# Altium project Gateway-Device-v1.0.PrjPcb (part 2 of 3)
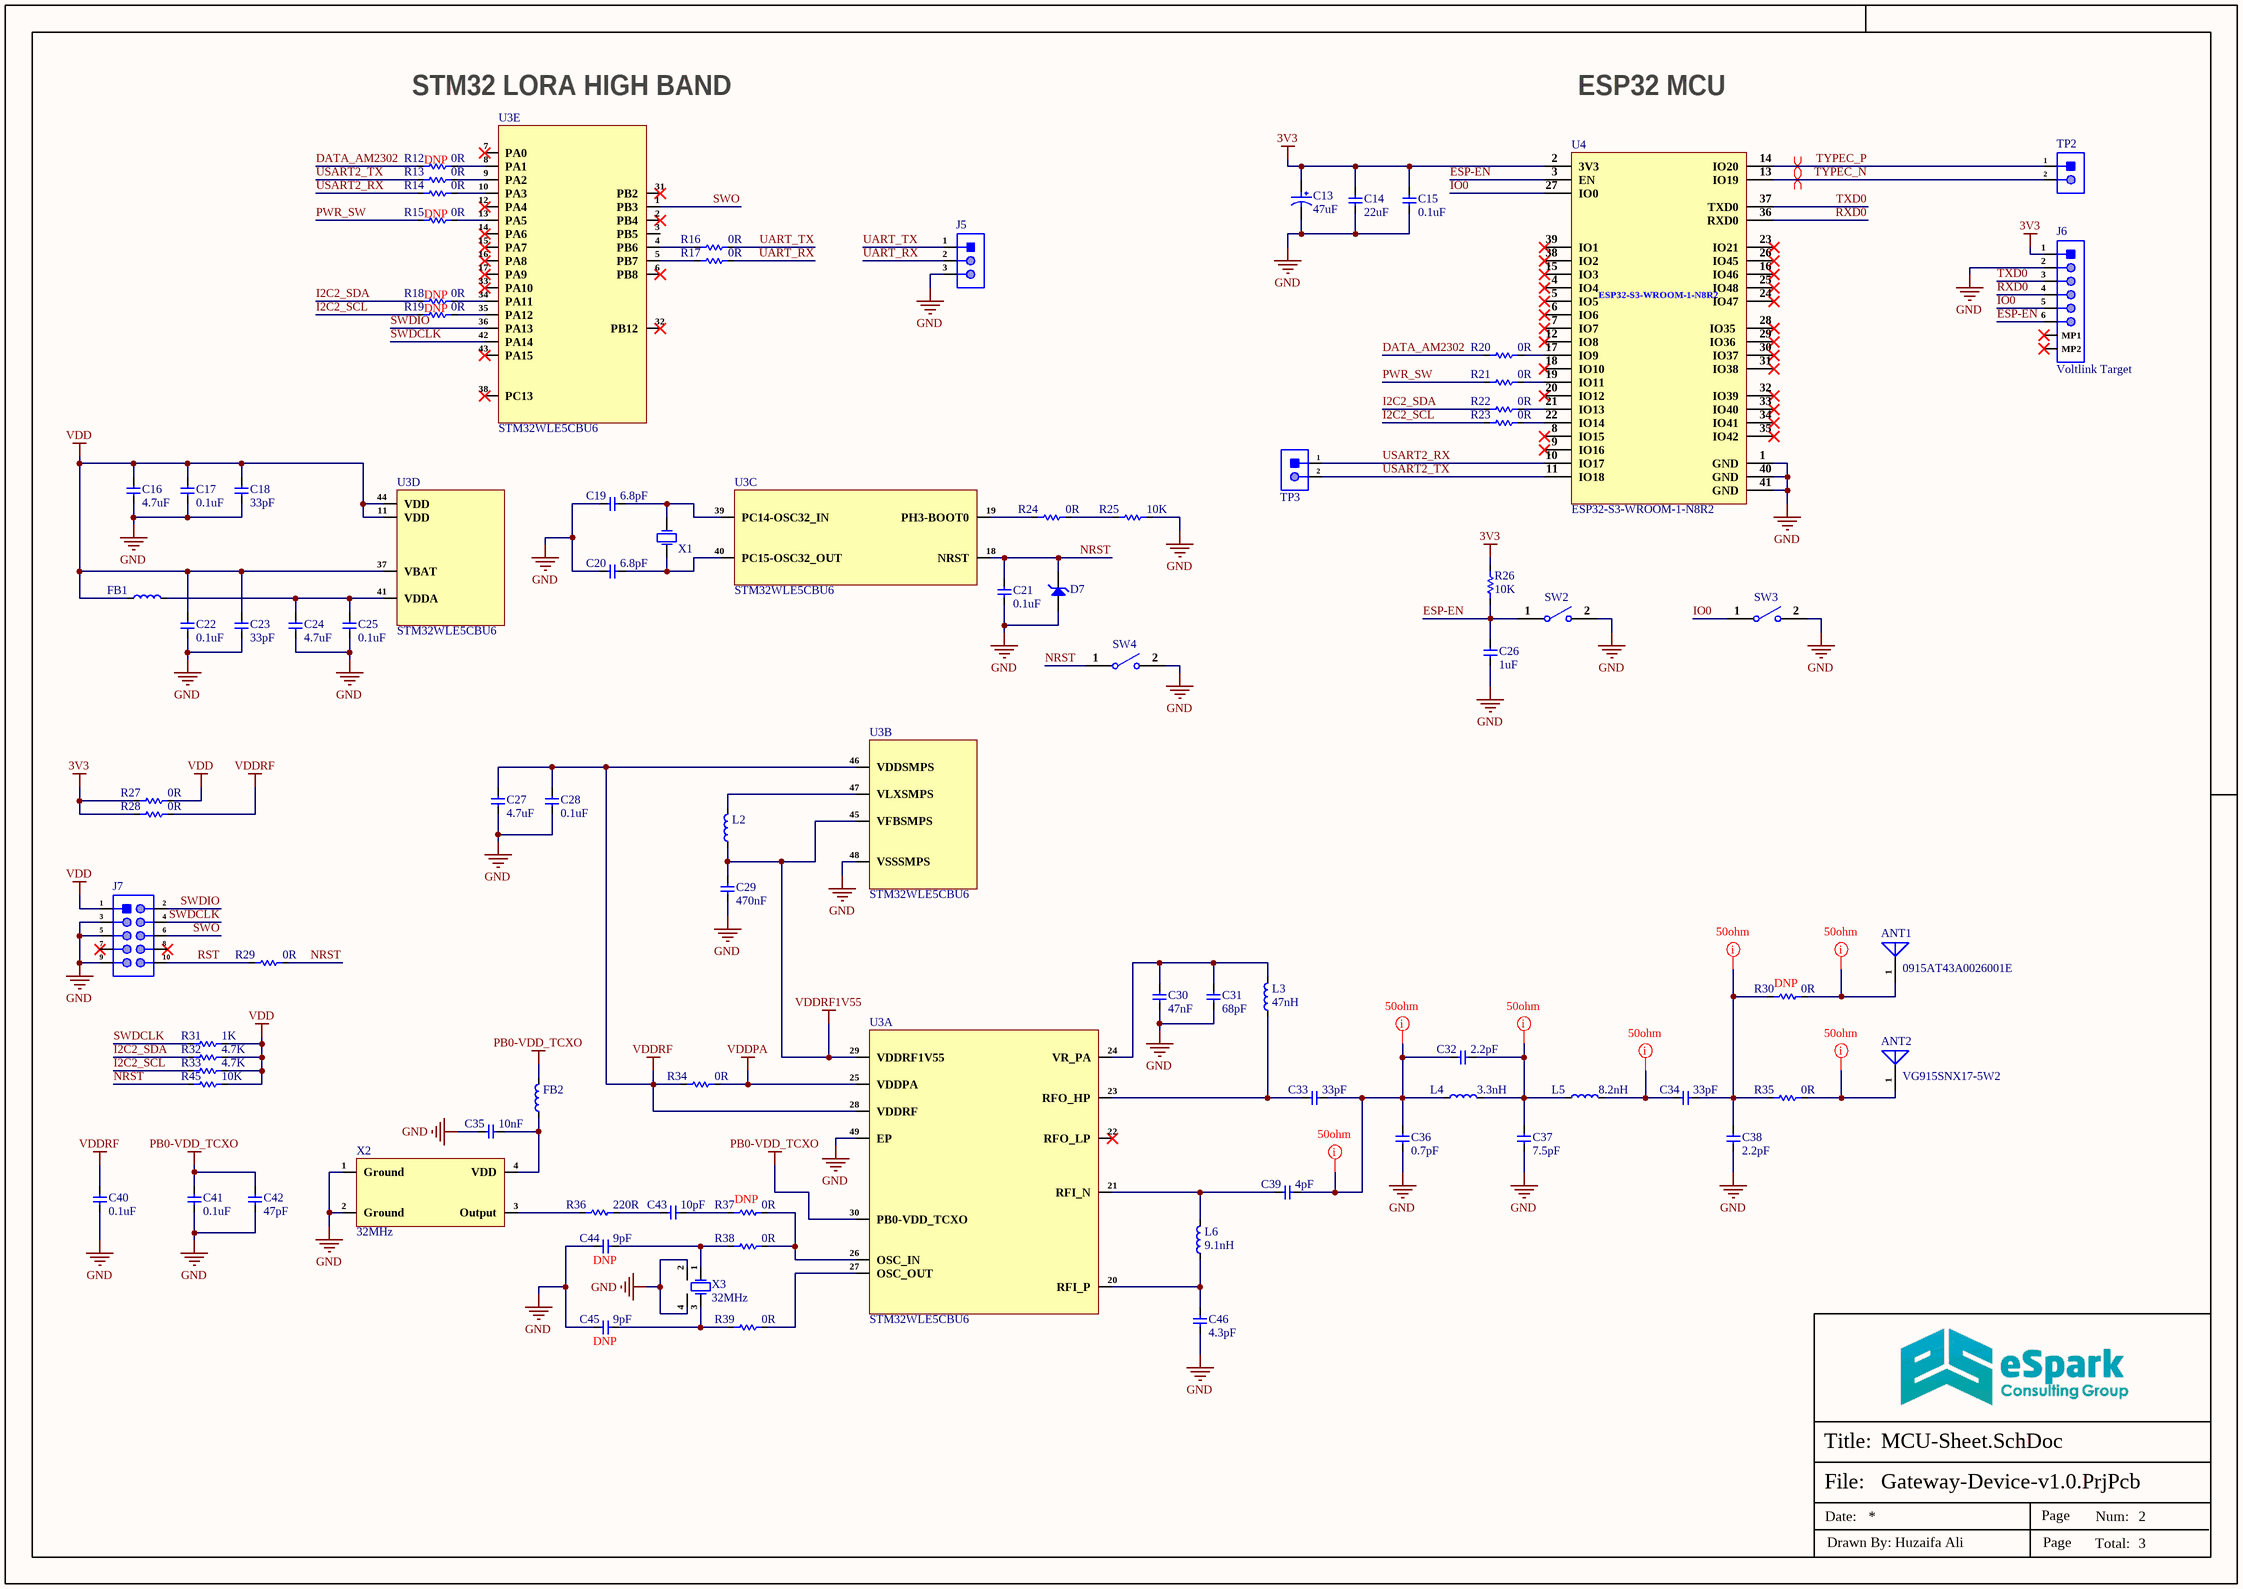
[diagram p3: MCU-Sheet.SchDoc]

## Sheet MCU-Sheet.SchDoc (continued)
### Library data of the parts
ANT1 = 0915AT43A0026001E: RF ANT 915MHZ CHIP SOLDER SMD; Manufacturer: Johanson; Item Type: RF Antennas; Supplier: Digikey; LCSC Part Number: C17443637; Manufacturer Part Number: 0915AT43A0026001E; RoHS: No; Stock: 101852; Pricing: 1=0.82, 10=0.585, 25=0.5268, 100=0.4622, 250=0.43144, 500=0.4129 (USD)
ANT2 = VG915SNX17-5W2: 1.8 Helical Antenna Vertical 915MHz 50W Antennas ROHS; Manufacturer: Vollgo; Manufacturer Part Number: VG915SNX17-5W2; Package: Custom; LCSC Part Number: C718842; Item Type: Antenna; ComponentLink1Description: LCSC; ComponentLink1URL: https://lcsc.com/product-detail/Antennas_Vollgo-VG915SNX17-5W2_C718842.html
C13 = RVT1E470M0505: 47uF 25V 49mA@120Hz ±20% SMD,D5xL5.4mm Aluminum Electrolytic Capacitors - SMD ROHS; Manufacturer: ROQANG; Manufacturer Part Number: RVT1E470M0505; Package: SMD,D5xL5.4mm; LCSC Part Number: C2977553; Item Type: Capacitor; ComponentLink1Description: LCSC; ComponentLink1URL: https://www.lcsc.com/product-detail/Aluminum-Electrolytic-Capacitors-SMD_ROQANG-RVT1E470M0505_C2977553.html
C14 = GRM21BZ71A226ME15L: CAP CER 22UF 10V X7R 0805; Manufacturer: Murata; Material: 4241ConductorMaterial; Tolerance: 20%; Item Type: Capacitor; Supplier: Digi-Key; Supplier Part Number: 490-GRM21BZ71A226ME15LCT-ND; Manufacturer Part Number: GRM21BZ71A226ME15L; RoHS: Yes; Category: Ceramic Capacitors; Stock: 49126; Pricing: 1=0.39, 10=0.259, 50=0.191, 100=0.1556, 500=0.12282, 1000=0.10372 (USD); Package: 0805; Min Operating Temperature: -55°C; Max Operating Temperature: 125°C; Value: 22uF; Voltage Rating: 10V; Length: 2mm; Width: 1.25mm; Height: 1.45mm; Thickness: 1.25mm; ComponentLink1URL: https://datasheet.octopart.com/GRM21BZ71A226ME15L-Murata-datasheet-165579666.pdf?src-supplier=TME; ComponentLink1Description: https://datasheet.octopart.com/GRM21BZ71A226ME15L-Murata-datasheet-165579666.pdf?src-supplier=TME; LCSC Part Number: C907991; ComponentLink2Description: LCSC; ComponentLink2URL: https://www.lcsc.com/product-detail/Multilayer-Ceramic-Capacitors-MLCC-SMD-SMT_Murata-Electronics-GRM21BZ71A226ME15L_C907991.html
C15 C17 C21 C22 C25 C28 C40 C41 = CC0402KRX7R8BB104: CAP CER 0.1UF 25V X7R 0402; Manufacturer: Yageo; Tolerance: 10%; Capacitance: 100nF; Dissipation Factor: 3.5%; Supplier 1: Digi-Key; Manufacturer Part Number: CC0402KRX7R8BB104; RoHS: Yes; Category: Ceramic Capacitors; Stock 1: 1841009; Pricing 1: 1=0.10000, 10=0.03100, 50=0.01700, 100=0.01390, 500=0.00990, 1000=0.00777, 2500=0.00707, 5000=0.00650 (USD); Mount: Surface Mount; Case/Package: 0402; Case Code (Imperial): 0402; Case Code (Metric): 1005; Min Operating Temperature: -55°C; Max Operating Temperature: 125°C; Dielectric: X7R; Voltage Rating: 25V; Voltage Rating (DC): 25V; Packaging: Tape and Reel; Termination: SMD/SMT; Resistor Type: Ceramic; Length: 1mm; Width: 0.02inch; Height: 0.5mm; Thickness: 0.022inch; Depth: 0.5mm; Radiation Hardening: No; Lead Free: Lead Free; Halogen Free: Halogen Free; ComponentLink1URL: https://datasheet.ciiva.com/11464/upy-gphc-x7r-6-3v-to-50v-8-11464889.pdf?src-supplier=Avnet; ComponentLink1Description: https://datasheet.ciiva.com/11464/upy-gphc-x7r-6-3v-to-50v-8-11464889.pdf?src-supplier=Avnet; ComponentLink2URL: https://datasheet.ciiva.com/13210/upy-gphc-x7r-6-3v-to-50v-8-12304-13210908.pdf?src-supplier=Mouser; ComponentLink2Description: https://datasheet.ciiva.com/13210/upy-gphc-x7r-6-3v-to-50v-8-12304-13210908.pdf?src-supplier=Mouser; ComponentLink3URL: https://datasheet.ciiva.com/17437/upy-gphc-x7r-6-3v-to-50v-8-17437357.pdf?src-supplier=Avnet+Europe; ComponentLink3Description: https://datasheet.ciiva.com/17437/upy-gphc-x7r-6-3v-to-50v-8-17437357.pdf?src-supplier=Avnet+Europe; Supplier Part Number 1: 311-2077-1-ND; LCSC Part Number: C105883
C16 C24 C27 = CL05A475MO5NUNC: CAP CER 4.7UF 16V X5R 0402; Manufacturer: Samsung; Material: 4241ConductorMaterial; Tolerance: 20%; Supplier 1: Avnet; Manufacturer Part Number: CL05A475MO5NUNC; RoHS: Yes; Category: Ceramic Capacitors; Stock 1: 50000; Pricing 1: 10000=0.09712 (USD); Mount: Surface Mount; Case/Package: 0402; Case Code (Metric): 1005; Case Code (Imperial): 0402; Min Operating Temperature: -55°C; Max Operating Temperature: 85°C; Packaging: Cut Tape; Capacitance: 4.7uF; Voltage Rating: 16V; Series: CL; Voltage Rating (DC): 16V; Length: 0.039inch; Width: 0.02inch; Height: 550um; Thickness: 0.022inch; RoHS Compliant: Yes; ComponentLink1URL: http://www.farnell.com/datasheets/2710653.pdf?src-supplier=Farnell; ComponentLink1Description: http://www.farnell.com/datasheets/2710653.pdf?src-supplier=Farnell; ComponentLink2URL: http://www.samsungsem.com/kr/support/product-search/mlcc/CL05A475MO5NUNC.jsp?src-supplier=Digikey; ComponentLink2Description: http://www.samsungsem.com/kr/support/product-search/mlcc/CL05A475MO5NUNC.jsp?src-supplier=Digikey; ComponentLink3URL: http://www.farnell.com/datasheets/2710653.pdf?src-supplier=Element14; ComponentLink3Description: http://www.farnell.com/datasheets/2710653.pdf?src-supplier=Element14; ComponentLink4URL: https://datasheet.octopart.com/CL05A475MO5NUNC-Samsung-Electro-Mechanics-datasheet-123102911.pdf?src-supplier=Future+Electronics; ComponentLink4Description: https://datasheet.octopart.com/CL05A475MO5NUNC-Samsung-Electro-Mechanics-datasheet-123102911.pdf?src-supplier=Future+Electronics; ComponentLink5URL: http://www.farnell.com/datasheets/2710653.pdf?src-supplier=Newark; ComponentLink5Description: http://www.farnell.com/datasheets/2710653.pdf?src-supplier=Newark; Supplier Part Number 1: CL05A475MO5NUNC
C18 C23 C33 C34 = GJM1555C1H330GB01D: CAP CER 33PF 50V C0G/NP0 0402; Manufacturer: Murata; Item Type: Capacitors; Material: 4241ConductorMaterial; Tolerance: 2%; Dielectric: 1510DielectricType; Temperature Coefficient: 30ppm/°C; Supplier: Mouser; LCSC Part Number: C76905; Manufacturer Part Number: GJM1555C1H330GB01D; RoHS: Yes; Stock: 30599; Pricing: 1=0.12, 10=0.069, 50=0.069, 100=0.042, 1000=0.028, 10000=0.018 (USD); Case/Package: 343Case; Min Operating Temperature: -55°C; Max Operating Temperature: 125°C; Value: 33pF; Voltage Rating (DC): 50V; Voltage Rating: 50V; Length: 1mm; Width: 500um; Height: 550um; Thickness: 500um; ComponentLink1URL: https://datasheet.octopart.com/GJM1555C1H330GB01D-Murata-datasheet-12511495.pdf?src-supplier=TME; ComponentLink1Description: https://datasheet.octopart.com/GJM1555C1H330GB01D-Murata-datasheet-12511495.pdf?src-supplier=TME
C19 C20 = CC0402CRNPO9BN6R8: CAP CER 6.8PF 50V C0G/NPO 0402; Manufacturer: Yageo; Dielectric: C0G; Tolerance: 2%; Insulation Resistance: 10GR; Item Type: Capacitor; Supplier: Future Electronics; Supplier Part Number: 3247368; Manufacturer Part Number: CC0402CRNPO9BN6R8; RoHS: Yes; Category: Ceramic Capacitors; Stock: 200000; Pricing: 10000=0.0024, 40000=0.0022, 150000=0.0021, 400000=0.002, 1000000=0.0019 (USD); Mounting Technology: Surface Mount; Case/Package: 0402; Case Code (Imperial): 0402; Case Code (Metric): 1005; Weight: 2.3E-05oz; Min Operating Temperature: -55°C; Max Operating Temperature: 125°C; Value: 6.8pF; Packaging: Tape and Reel; Voltage Rating: 50V; Voltage Rating (DC): 50V; Termination: SMD/SMT; Series: CC; Construction: Flat; Length: 1mm; Width: 0.5mm; Height: 0.5mm; Depth: 0.5mm; Radiation Hardening: No; RoHS Compliant: Yes; ComponentLink1URL: https://datasheet.ciiva.com/11587/upy-gp-np0-16v-to-50v-8-11587182.pdf?src-supplier=Avnet; ComponentLink1Description: https://datasheet.ciiva.com/11587/upy-gp-np0-16v-to-50v-8-11587182.pdf?src-supplier=Avnet; LCSC Part Number: C189470
C26 = GRM155R70J105KA12J: CAP CER 1UF 6.3V X7R 0402; Manufacturer: Murata; Item Type: Capacitors; Material: 4241ConductorMaterial; Tolerance: 10%; Supplier: Mouser; LCSC Part Number: C2167130; Manufacturer Part Number: GRM155R70J105KA12J; RoHS: Yes; Stock: 273640; Pricing: 1=0.1, 10=0.01, 50=0.01, 100=0.008, 1000=0.008, 10000=0.007 (USD); Mounting Technology: Surface Mount; Case/Package: 0402; Pins: 2NUMBER; Case Code (Metric): 1005; Case Code (Imperial): 0402; Weight: 0.000212oz; Min Operating Temperature: -55°C; Max Operating Temperature: 125°C; Packaging: Tape and Reel; Value: 1uF; Voltage Rating: 6.3V; Dielectric: X7R; Termination: SMD/SMT; Voltage Rating (DC): 6.3V; Package Quantity: 50000; Series: GRM; Length: 0.039inch; Width: 0.02inch; Height: 550um; Thickness: 0.022inch; RoHS Compliant: Yes; ComponentLink1URL: http://www.mouser.com/ds/2/281/c02e-2905.pdf?src-supplier=Mouser; ComponentLink1Description: http://www.mouser.com/ds/2/281/c02e-2905.pdf?src-supplier=Mouser; ComponentLink2URL: https://datasheet.octopart.com/GRM155R70J105KA12J-Murata-datasheet-32479577.pdf?src-supplier=Future+Electronics; ComponentLink2Description: https://datasheet.octopart.com/GRM155R70J105KA12J-Murata-datasheet-32479577.pdf?src-supplier=Future+Electronics; ComponentLink3URL: https://datasheet.octopart.com/GRM155R70J105KA12J-Murata-datasheet-155345054.pdf?src-supplier=Element14; ComponentLink3Description: https://datasheet.octopart.com/GRM155R70J105KA12J-Murata-datasheet-155345054.pdf?src-supplier=Element14; ComponentLink4URL: http://search.murata.co.jp/Ceramy/image/img/A01X/G101/ENG/GRM155R70J105KA12-01.pdf?src-supplier=Digikey; ComponentLink4Description: http://search.murata.co.jp/Ceramy/image/img/A01X/G101/ENG/GRM155R70J105KA12-01.pdf?src-supplier=Digikey; ComponentLink5URL: https://datasheet.octopart.com/GRM155R70J105KA12J-Murata-datasheet-165579666.pdf?src-supplier=TME; ComponentLink5Description: https://datasheet.octopart.com/GRM155R70J105KA12J-Murata-datasheet-165579666.pdf?src-supplier=TME
C29 = GRM155R61H474KE11D: CAP CER 0.47UF 50V X5R 0402; Manufacturer: Murata; Item Type: Capacitors; Material: 4241ConductorMaterial; Tolerance: 10%; Supplier: Arrow Electronics; LCSC Part Number: C437527; Manufacturer Part Number: GRM155R61H474KE11D; RoHS: Yes; Stock: 22879; Pricing: 7407=0.0141, 15000=0.01 (USD); Mounting Technology: Surface Mount; Case/Package: 0402; Case Code (Imperial): 0402; Case Code (Metric): 1005; Min Operating Temperature: -55°C; Max Operating Temperature: 85°C; Voltage Rating (DC): 50V; Dielectric: X5R; Value: 470nF; Series: GRM; Packaging: Cut Tape; Voltage Rating: 50V; Length: 1mm; Width: 500um; Height: 600um; Thickness: 500um; RoHS Compliant: Yes; ComponentLink1URL: https://datasheet.octopart.com/GRM155R61H474KE11D-Murata-datasheet-149523035.pdf?src-supplier=Newark; ComponentLink1Description: https://datasheet.octopart.com/GRM155R61H474KE11D-Murata-datasheet-149523035.pdf?src-supplier=Newark; ComponentLink2URL: https://datasheet.octopart.com/GRM155R61H474KE11D-Murata-datasheet-99353828.pdf?src-supplier=Future+Electronics; ComponentLink2Description: https://datasheet.octopart.com/GRM155R61H474KE11D-Murata-datasheet-99353828.pdf?src-supplier=Future+Electronics; ComponentLink3URL: http://search.murata.co.jp/Ceramy/image/img/A01X/G101/ENG/GRM155R61H474KE11-01.pdf?src-supplier=Digikey; ComponentLink3Description: http://search.murata.co.jp/Ceramy/image/img/A01X/G101/ENG/GRM155R61H474KE11-01.pdf?src-supplier=Digikey; ComponentLink4URL: https://search.murata.co.jp/Ceramy/image/img/A01X/G101/ENG/GRM155R61H474KE11-01.pdf?src-supplier=Digikey; ComponentLink4Description: https://search.murata.co.jp/Ceramy/image/img/A01X/G101/ENG/GRM155R61H474KE11-01.pdf?src-supplier=Digikey; ComponentLink5URL: https://datasheet.octopart.com/GRM155R61H474KE11D-Murata-datasheet-118179445.pdf?src-supplier=LCSC; ComponentLink5Description: https://datasheet.octopart.com/GRM155R61H474KE11D-Murata-datasheet-118179445.pdf?src-supplier=LCSC; ComponentLink6URL: https://datasheet.octopart.com/GRM155R61H474KE11D-Murata-datasheet-165579666.pdf?src-supplier=TME; ComponentLink6Description: https://datasheet.octopart.com/GRM155R61H474KE11D-Murata-datasheet-165579666.pdf?src-supplier=TME
C30 = CC0402KRX7R9BB473: CAP CER 0.047UF 50V X7R 0402; Manufacturer: Yageo; Material: 4241ConductorMaterial; Tolerance: 10%; Temperature Coefficient: 30ppm/°C; Dielectric: 1511DielectricType; Item Type: Capacitor; Supplier: Future Electronics; Supplier Part Number: 2095687; Manufacturer Part Number: CC0402KRX7R9BB473; RoHS: Yes; Category: Ceramic Capacitors; Stock: 1130000; Pricing: 10000=0.0044, 40000=0.0042, 100000=0.004, 150000=0.0041, 250000=0.0039, 400000=0.0037, 500000=0.0038 (USD); Mounting Technology: Surface Mount; Case/Package: 0402; Case Code (Imperial): 0402; Case Code (Metric): 1005; Min Operating Temperature: -55°C; Max Operating Temperature: 125°C; Packaging: Tape and Reel; Value: 47nF; Voltage Rating: 50V; Series: CC; Voltage Rating (DC): 50V; Length: 0.039inch; Width: 0.02inch; Height: 550um; Thickness: 0.022inch; RoHS Compliant: Yes; Halogen Free: 5694HalogenFree; Lead Free: 5697LeadFree; ComponentLink1URL: https://datasheet.octopart.com/CC0402KRX7R9BB473-Yageo-datasheet-166511530.pdf?src-supplier=Future+Electronics; ComponentLink1Description: https://datasheet.octopart.com/CC0402KRX7R9BB473-Yageo-datasheet-166511530.pdf?src-supplier=Future+Electronics; ComponentLink2URL: http://www.yageo.com/documents/recent/UPY-GPHC_X7R_6.3V-to-50V_18.pdf?src-supplier=Digikey; ComponentLink2Description: http://www.yageo.com/documents/recent/UPY-GPHC_X7R_6.3V-to-50V_18.pdf?src-supplier=Digikey; ComponentLink3URL: https://datasheet.octopart.com/CC0402KRX7R9BB473-Yageo-datasheet-140260305.pdf?src-supplier=Newark; ComponentLink3Description: https://datasheet.octopart.com/CC0402KRX7R9BB473-Yageo-datasheet-140260305.pdf?src-supplier=Newark; LCSC Part Number: C272875
C31 = CC0402FRNPO9BN680: CAP CER 68PF 50V C0G/NPO 0402; Manufacturer: Yageo; Item Type: Capacitors; Supplier: Digikey; LCSC Part Number: C389103; Manufacturer Part Number: CC0402FRNPO9BN680; RoHS: Yes; Stock: 155; Pricing: 1=0.1, 10=0.049, 100=0.0288, 1000=0.01861, 2500=0.01608, 5000=0.01457 (USD); Lead Free: 5697LeadFree; Halogen Free: 5694HalogenFree; ComponentLink1URL: https://datasheet.ciiva.com/15189/getdatasheetpartid-646623-15189115.pdf?src-supplier=Verical; ComponentLink1Description: https://datasheet.ciiva.com/15189/getdatasheetpartid-646623-15189115.pdf?src-supplier=Verical; ComponentLink2URL: https://datasheet.ciiva.com/11587/upy-gp-np0-16v-to-50v-8-11587064.pdf?src-supplier=Avnet; ComponentLink2Description: https://datasheet.ciiva.com/11587/upy-gp-np0-16v-to-50v-8-11587064.pdf?src-supplier=Avnet; ComponentLink3URL: https://datasheet.ciiva.com/13210/upy-gp-np0-16v-to-50v-8-13210234.pdf?src-supplier=Mouser; ComponentLink3Description: https://datasheet.ciiva.com/13210/upy-gp-np0-16v-to-50v-8-13210234.pdf?src-supplier=Mouser
C32 C38 = GRM1555C1H2R2BA01D: CAP CER 2.2PF 50V C0G/NP0 0402; Manufacturer: Murata; Material: Ceramic; Dielectric: C0G; Temperature Coefficient: 30ppm/°C; Item Type: Capacitor; Supplier: Avnet; Supplier Part Number: GRM1555C1H2R2BA01D; Manufacturer Part Number: GRM1555C1H2R2BA01D; RoHS: Yes; Category: Ceramic Capacitors; Stock: 110000; Pricing: 10000=0.00887, 20000=0.00867, 40000=0.00847 (USD); Mounting Technology: Surface Mount; Case/Package: 0402; Case Code (Imperial): 0402; Case Code (Metric): 1005; Min Operating Temperature: -55°C; Max Operating Temperature: 125°C; Value: 2.2pF; Packaging: Tape and Reel; Package Quantity: 1; Termination: SMD/SMT; Series: GRM; Voltage Rating: 50V; Voltage Rating (DC): 50V; Voltage: 50V; Construction: Flat; Length: 1mm; Width: 0.5mm; Height: 0.5mm; Thickness: 0.022inch; Depth: 0.5mm; Radiation Hardening: No; Reach SVHC Compliant: No; RoHS Compliant: Yes; Lead Free: Lead Free; ComponentLink1URL: https://datasheet.ciiva.com/6270/grm1555c1h2r1wa01-01-6270869.pdf?src-supplier=Digi-Key; ComponentLink1Description: https://datasheet.ciiva.com/6270/grm1555c1h2r1wa01-01-6270869.pdf?src-supplier=Digi-Key; ComponentLink2URL: https://datasheet.ciiva.com/18184/getdatasheetpartid-316203-18184296.pdf?src-supplier=Verical; ComponentLink2Description: https://datasheet.ciiva.com/18184/getdatasheetpartid-316203-18184296.pdf?src-supplier=Verical; ComponentLink3URL: https://datasheet.ciiva.com/16440/c02e-16440539.pdf?src-supplier=Future+Electronics; ComponentLink3Description: https://datasheet.ciiva.com/16440/c02e-16440539.pdf?src-supplier=Future+Electronics; ComponentLink4URL: https://datasheet.ciiva.com/6270/partnumbering-e-01-6270873.pdf?src-supplier=Digi-Key; ComponentLink4Description: https://datasheet.ciiva.com/6270/partnumbering-e-01-6270873.pdf?src-supplier=Digi-Key; ComponentLink5URL: https://datasheet.ciiva.com/6270/partnumbering-e-01-6270877.pdf?src-supplier=Digi-Key; ComponentLink5Description: https://datasheet.ciiva.com/6270/partnumbering-e-01-6270877.pdf?src-supplier=Digi-Key; ComponentLink6URL: https://datasheet.ciiva.com/11615/product-11615030.pdf?src-supplier=Avnet; ComponentLink6Description: https://datasheet.ciiva.com/11615/product-11615030.pdf?src-supplier=Avnet; LCSC Part Number: C88927
C35 = GRM155R71H103KA88D: CAP CER 10000PF 50V X7R 0402; Manufacturer: Murata; Item Type: Capacitors; Material: Ceramic; Tolerance: 10%; Voltage: 25V; Supplier: Arrow Electronics; LCSC Part Number: C77019; Manufacturer Part Number: GRM155R71H103KA88D; RoHS: Yes; Stock: 7440000; Pricing: 30000=0.0032, 50000=0.003, 70000=0.0029, 100000=0.0028, 250000=0.0025, 500000=0.0023 (USD); Mounting Technology: Surface Mount; Case/Package: 0402; Pins: 2; Case Code (Metric): 1005; Case Code (Imperial): 0402; Min Operating Temperature: -55°C; Max Operating Temperature: 125°C; Value: 10nF; Packaging: Tape and Reel; Package Quantity: 1; Voltage Rating: 50V; Dielectric: X7R; Termination: SMD/SMT; Series: GRM; Construction: Flat; Voltage Rating (DC): 50V; Length: 1mm; Width: 0.02inch; Height: 0.5mm; Thickness: 0.022inch; Depth: 0.5mm; Radiation Hardening: No; Reach SVHC Compliant: No; RoHS Compliant: Yes; Lead Free: 5697LeadFree; ComponentLink1URL: https://datasheet.ciiva.com/22698/1747449-22698420.pdf?src-supplier=Element14; ComponentLink1Description: https://datasheet.ciiva.com/22698/1747449-22698420.pdf?src-supplier=Element14; ComponentLink2URL: https://datasheet.ciiva.com/19476/1856433-19476546.pdf?src-supplier=Jameco; ComponentLink2Description: https://datasheet.ciiva.com/19476/1856433-19476546.pdf?src-supplier=Jameco; ComponentLink3URL: https://datasheet.ciiva.com/129/product-129810.pdf?src-supplier=Digikey; ComponentLink3Description: https://datasheet.ciiva.com/129/product-129810.pdf?src-supplier=Digikey; ComponentLink4URL: https://datasheet.ciiva.com/11786/0900766b80ef921d-11786340.pdf?src-supplier=Rs; ComponentLink4Description: https://datasheet.ciiva.com/11786/0900766b80ef921d-11786340.pdf?src-supplier=Rs; ComponentLink5URL: https://datasheet.ciiva.com/18100/getdatasheetpartid-27434-18100660.pdf?src-supplier=Verical; ComponentLink5Description: https://datasheet.ciiva.com/18100/getdatasheetpartid-27434-18100660.pdf?src-supplier=Verical; ComponentLink6URL: https://datasheet.ciiva.com/29199/454225-da-01-en-vs-kondensator-0402-29199740.pdf?src-supplier=Conrad; ComponentLink6Description: https://datasheet.ciiva.com/29199/454225-da-01-en-vs-kondensator-0402-29199740.pdf?src-supplier=Conrad; ComponentLink7URL: https://datasheet.ciiva.com/129/grm155r71h103ka88-01-129811.pdf?src-supplier=Digikey; ComponentLink7Description: https://datasheet.ciiva.com/129/grm155r71h103ka88-01-129811.pdf?src-supplier=Digikey; ComponentLink8URL: https://datasheet.ciiva.com/129/grm155r71h103ka88-01-129812.pdf?src-supplier=Digikey; ComponentLink8Description: https://datasheet.ciiva.com/129/grm155r71h103ka88-01-129812.pdf?src-supplier=Digikey; ComponentLink9URL: https://datasheet.ciiva.com/5410/product-5410990.pdf?src-supplier=Mouser; ComponentLink9Description: https://datasheet.ciiva.com/5410/product-5410990.pdf?src-supplier=Mouser; ComponentLink10URL: https://datasheet.ciiva.com/16495/product-16495290.pdf?src-supplier=Future+Electronics; ComponentLink10Description: https://datasheet.ciiva.com/16495/product-16495290.pdf?src-supplier=Future+Electronics
C36 = GJM1555C1HR70BB01D: CAP CER 0.7PF 50V C0G/NP0 0402; Manufacturer: Murata; Item Type: Capacitors; Material: 4241ConductorMaterial; Temperature Coefficient: 30ppm/°C; Supplier: Arrow Electronics; LCSC Part Number: C161349; Manufacturer Part Number: GJM1555C1HR70BB01D; RoHS: Yes; Stock: 979; Pricing: 979=0.0104 (USD); Lead Free: 5697LeadFree; ComponentLink1URL: https://datasheet.ciiva.com/6270/product-6270549.pdf?src-supplier=Digikey; ComponentLink1Description: https://datasheet.ciiva.com/6270/product-6270549.pdf?src-supplier=Digikey; ComponentLink2URL: https://datasheet.ciiva.com/6270/partnumbering-e-01-6270550.pdf?src-supplier=Digikey; ComponentLink2Description: https://datasheet.ciiva.com/6270/partnumbering-e-01-6270550.pdf?src-supplier=Digikey; ComponentLink3URL: https://datasheet.ciiva.com/6270/partnumbering-e-01-6270551.pdf?src-supplier=Digikey; ComponentLink3Description: https://datasheet.ciiva.com/6270/partnumbering-e-01-6270551.pdf?src-supplier=Digikey; ComponentLink4URL: https://datasheet.ciiva.com/11616/product-11616965.pdf?src-supplier=Avnet; ComponentLink4Description: https://datasheet.ciiva.com/11616/product-11616965.pdf?src-supplier=Avnet
C37 = GJM1555C1H7R5BB01D: CAP CER 7.5PF 50V C0G/NP0 0402; Manufacturer: Murata; Item Type: Capacitors; Material: 4241ConductorMaterial; Temperature Coefficient: 30ppm/°C; Supplier: Arrow Electronics; LCSC Part Number: C497526; Manufacturer Part Number: GJM1555C1H7R5BB01D; RoHS: Yes; Stock: 9925; Pricing: 9925=0.0103 (USD); ComponentLink1URL: https://datasheet.ciiva.com/11610/product-11610696.pdf?src-supplier=Avnet; ComponentLink1Description: https://datasheet.ciiva.com/11610/product-11610696.pdf?src-supplier=Avnet
C39 = GJM1555C1H4R0BB01D: CAP CER 4PF 50V C0G/NP0 0402; Manufacturer: Murata; Item Type: Capacitors; Material: 4241ConductorMaterial; Dielectric: C0G; Temperature Coefficient: 30ppm/°C; Supplier: Arrow Electronics; LCSC Part Number: C161323; Manufacturer Part Number: GJM1555C1H4R0BB01D; RoHS: Yes; Stock: 40000; Pricing: 10000=0.0105 (USD); Mounting Technology: Surface Mount; Case/Package: 0402; Case Code (Metric): 1005; Case Code (Imperial): 0402; Min Operating Temperature: -55°C; Max Operating Temperature: 125°C; Value: 4pF; Packaging: Tape and Reel; Package Quantity: 1; Voltage Rating: 50V; Voltage Rating (DC): 50V; Termination: SMD/SMT; Series: GJM; Construction: Flat; Length: 1mm; Width: 0.02inch; Height: 0.5mm; Thickness: 0.022inch; Depth: 0.5mm; Radiation Hardening: No; Lead Free: Lead Free; RoHS Compliant: Yes; ComponentLink1URL: https://datasheet.ciiva.com/11613/product-11613609.pdf?src-supplier=Avnet; ComponentLink1Description: https://datasheet.ciiva.com/11613/product-11613609.pdf?src-supplier=Avnet; ComponentLink2URL: https://datasheet.ciiva.com/26947/getdatasheetpartid-725490-26947669.pdf?src-supplier=Verical; ComponentLink2Description: https://datasheet.ciiva.com/26947/getdatasheetpartid-725490-26947669.pdf?src-supplier=Verical; ComponentLink3URL: https://datasheet.ciiva.com/29542/partnumbering-e-01-29542697.pdf?src-supplier=Digikey; ComponentLink3Description: https://datasheet.ciiva.com/29542/partnumbering-e-01-29542697.pdf?src-supplier=Digikey; ComponentLink4URL: https://datasheet.ciiva.com/29542/partnumbering-e-01-29542696.pdf?src-supplier=Digikey; ComponentLink4Description: https://datasheet.ciiva.com/29542/partnumbering-e-01-29542696.pdf?src-supplier=Digikey; ComponentLink5URL: https://datasheet.ciiva.com/29542/partnumbering-e-01-29542698.pdf?src-supplier=Digikey; ComponentLink5Description: https://datasheet.ciiva.com/29542/partnumbering-e-01-29542698.pdf?src-supplier=Digikey
C42 = GCM1555C1H470FA16D: CAP CER 47PF 50V C0G/NP0 0402; Manufacturer: Murata; Tolerance: 1%; Supplier 1: Digi-Key; Manufacturer Part Number: GCM1555C1H470FA16D; RoHS: No; Category: Ceramic Capacitors; Stock 1: 27098; Pricing 1: 1=0.11000, 10=0.07900, 50=0.04500, 100=0.03730, 500=0.02618, 1000=0.02168, 2500=0.02018, 5000=0.01846 (USD); Mount: Surface Mount; Case/Package: 0402; Case Code (Imperial): 0402; Case Code (Metric): 1005; Min Operating Temperature: -55°C; Max Operating Temperature: 125°C; Packaging: Tape and Reel; Capacitance: 47pF; Voltage Rating: 50V; Ratings: AEC-Q200; ComponentLink1URL: http://search.murata.co.jp/Ceramy/image/img/A01X/G101/ENG/GCM1555C1H470FA16-01.pdf?src-supplier=Digi-Key; ComponentLink1Description: http://search.murata.co.jp/Ceramy/image/img/A01X/G101/ENG/GCM1555C1H470FA16-01.pdf?src-supplier=Digi-Key; Supplier Part Number 1: 490-16445-1-ND; LCSC Part Number: C393684
C43 = GRM1555C1H100JA01D: CAP CER 10PF 50V C0G/NP0 0402; Manufacturer: Murata; Material: Ceramic; Dielectric: C0G; Tolerance: 5%; Item Type: Capacitor; Supplier: Arrow Electronics; Supplier Part Number: GRM1555C1H100JA01D; Manufacturer Part Number: GRM1555C1H100JA01D; RoHS: Yes; Category: Ceramic Capacitors; Stock: 3860000; Pricing: 10000=0.0034, 50000=0.0027, 100000=0.0023, 250000=0.0021 (USD); Mounting Technology: Surface Mount; Case/Package: 0402; Case Code (Metric): 1005; Case Code (Imperial): 0402; Min Operating Temperature: -55°C; Max Operating Temperature: 125°C; Value: 10pF; Voltage Rating: 50V; Packaging: Tape and Reel; Package Quantity: 1; Voltage Rating (DC): 50V; Termination: SMD/SMT; Series: GRM; Voltage: 50V; Construction: Flat; Length: 1mm; Width: 0.02inch; Height: 0.5mm; Depth: 0.5mm; Thickness: 0.022inch; Radiation Hardening: No; RoHS Compliant: Yes; Lead Free: Lead Free; Reach SVHC Compliant: No; ComponentLink1URL: https://datasheet.ciiva.com/2989/product-2989280.pdf?src-supplier=Avnet; ComponentLink1Description: https://datasheet.ciiva.com/2989/product-2989280.pdf?src-supplier=Avnet; ComponentLink2URL: https://datasheet.ciiva.com/18184/getdatasheetpartid-307234-18184164.pdf?src-supplier=Verical; ComponentLink2Description: https://datasheet.ciiva.com/18184/getdatasheetpartid-307234-18184164.pdf?src-supplier=Verical; ComponentLink3URL: https://datasheet.ciiva.com/29200/453545-da-01-en-vs-kondensator-0402-29200107.pdf?src-supplier=Conrad; ComponentLink3Description: https://datasheet.ciiva.com/29200/453545-da-01-en-vs-kondensator-0402-29200107.pdf?src-supplier=Conrad; ComponentLink4URL: https://datasheet.ciiva.com/7828/1666664-7828812.pdf?src-supplier=Element14; ComponentLink4Description: https://datasheet.ciiva.com/7828/1666664-7828812.pdf?src-supplier=Element14; ComponentLink5URL: https://datasheet.ciiva.com/6271/partnumbering-e-01-6271159.pdf?src-supplier=Digi-Key; ComponentLink5Description: https://datasheet.ciiva.com/6271/partnumbering-e-01-6271159.pdf?src-supplier=Digi-Key; ComponentLink6URL: https://datasheet.ciiva.com/6271/partnumbering-e-01-6271158.pdf?src-supplier=Digi-Key; ComponentLink6Description: https://datasheet.ciiva.com/6271/partnumbering-e-01-6271158.pdf?src-supplier=Digi-Key; ComponentLink7URL: https://datasheet.ciiva.com/6271/partnumbering-e-01-6271068.pdf?src-supplier=Digi-Key; ComponentLink7Description: https://datasheet.ciiva.com/6271/partnumbering-e-01-6271068.pdf?src-supplier=Digi-Key; LCSC Part Number: C76946
C44 C45 = CQ0402CRNPO9BN9R0: CAP CER 9PF 50V C0G/NPO 0402; Manufacturer: Yageo; Item Type: Capacitor; Supplier: Digikey; Supplier Part Number: CQ0402CRNPO9BN9R0-ND; Manufacturer Part Number: CQ0402CRNPO9BN9R0; RoHS: Yes; Category: Ceramic Capacitors; Pricing: 10000=0.02594 (USD); Mounting Technology: Surface Mount; Case/Package: 0402; Min Operating Temperature: -55°C; Max Operating Temperature: 125°C; Packaging: Tape and Reel; Value: 9pF; Voltage Rating: 50V; Series: CQ; ComponentLink1URL: http://www.yageo.com/documents/recent/UPY-High%20Q_NP0_16V-to-250V_13.pdf?src-supplier=Digikey; ComponentLink1Description: http://www.yageo.com/documents/recent/UPY-High%20Q_NP0_16V-to-250V_13.pdf?src-supplier=Digikey; LCSC Part Number: C577403
C46 = GJM1555C1H4R3BB01D: CAP CER 4.3PF 50V C0G/NP0 0402; Manufacturer: Murata; Item Type: Capacitors; Material: 4241ConductorMaterial; Dielectric: C0G; Temperature Coefficient: 30ppm/°C; Supplier: Mouser; LCSC Part Number: C426034; Manufacturer Part Number: GJM1555C1H4R3BB01D; RoHS: Yes; Stock: 11754; Pricing: 1=0.1, 10=0.05, 50=0.05, 100=0.03, 1000=0.021, 10000=0.011 (USD); Mounting Technology: Surface Mount; Case/Package: 0402; Case Code (Metric): 1005; Case Code (Imperial): 0402; Min Operating Temperature: -55°C; Max Operating Temperature: 125°C; Package Quantity: 1; Packaging: Tape and Reel; Value: 4.3pF; Voltage Rating: 50V; Voltage Rating (DC): 50V; Termination: SMD/SMT; Series: GJM; Construction: Flat; Length: 1mm; Width: 0.02inch; Height: 0.5mm; Thickness: 0.022inch; Depth: 0.5mm; Radiation Hardening: No; RoHS Compliant: Yes; ComponentLink1URL: https://datasheet.ciiva.com/11613/product-11613476.pdf?src-supplier=Avnet; ComponentLink1Description: https://datasheet.ciiva.com/11613/product-11613476.pdf?src-supplier=Avnet; ComponentLink2URL: https://datasheet.ciiva.com/29536/partnumbering-e-01-29536086.pdf?src-supplier=Digikey; ComponentLink2Description: https://datasheet.ciiva.com/29536/partnumbering-e-01-29536086.pdf?src-supplier=Digikey; ComponentLink3URL: https://datasheet.ciiva.com/29536/partnumbering-e-01-29536085.pdf?src-supplier=Digikey; ComponentLink3Description: https://datasheet.ciiva.com/29536/partnumbering-e-01-29536085.pdf?src-supplier=Digikey
D7 = ESDALC6V1-1U2: TVS DIODE 3VWM ST0201; Manufacturer: STMicroelectronics; Direction: Unidirectional; Value: 12pF; Number of Channels: 1; Reverse Breakdown Voltage: 6.1V; Reverse Standoff Voltage: 3V; Peak Pulse Power: 20W; Power Line Protection: No; Clamping Voltage: 12.2V; ESD Protection: Yes; Test Current: 1mA; Max Reverse Leakage Current: 100nA; Max Breakdown Voltage: 8V; Peak Pulse Current: 2A; Diode Type: ZENER; Supplier: Future Electronics; Supplier Part Number: 3110124; Manufacturer Part Number: ESDALC6V1-1U2; RoHS: Yes; Category: TVS Diodes; Stock: 405000; Pricing: 15000=0.0377, 45000=0.0364, 60000=0.0361, 150000=0.0351, 225000=0.0341 (USD); Mounting Technology: Surface Mount; Case/Package: 0201; Pins: 2; Case Code (Metric): 0603; Case Code (Imperial): 0201; Min Operating Temperature: -40°C; Max Operating Temperature: 125°C; Packaging: Tape and Reel; Number of Elements: 1; Number of Unidirectional Channels: 1; Min Breakdown Voltage: 6.1V; Breakdown Voltage: 6.1V; Polarity: Unidirectional; Termination: SMD/SMT; Leakage Current: 100nA; Max Power Dissipation: 20W; Power Dissipation: 20W; Series: ESDA, TRANSIL™; Length: 0.6mm; Width: 0.35mm; Height: 0.33mm; Depth: 0.3mm; Radiation Hardening: No; Reach SVHC Compliant: No; Lead Free: Lead Free; RoHS Compliant: Yes; ComponentLink1URL: https://datasheet.ciiva.com/1276/1684876-1276912.pdf?src-supplier=Element14; ComponentLink1Description: https://datasheet.ciiva.com/1276/1684876-1276912.pdf?src-supplier=Element14; ComponentLink2URL: https://datasheet.ciiva.com/4507/cd00212838-88488-4507763.pdf?src-supplier=Mouser; ComponentLink2Description: https://datasheet.ciiva.com/4507/cd00212838-88488-4507763.pdf?src-supplier=Mouser; ComponentLink3URL: https://datasheet.ciiva.com/16205/cd00212838-16205762.pdf?src-supplier=Future+Electronics; ComponentLink3Description: https://datasheet.ciiva.com/16205/cd00212838-16205762.pdf?src-supplier=Future+Electronics; ComponentLink4URL: https://datasheet.ciiva.com/15143/getdatasheetpartid-185245-15143908.pdf?src-supplier=Verical; ComponentLink4Description: https://datasheet.ciiva.com/15143/getdatasheetpartid-185245-15143908.pdf?src-supplier=Verical; ComponentLink5URL: https://datasheet.ciiva.com/22695/1684876-22695674.pdf?src-supplier=Element14; ComponentLink5Description: https://datasheet.ciiva.com/22695/1684876-22695674.pdf?src-supplier=Element14; ComponentLink6URL: https://datasheet.ciiva.com/337/cd00212838-337652.pdf?src-supplier=Digikey; ComponentLink6Description: https://datasheet.ciiva.com/337/cd00212838-337652.pdf?src-supplier=Digikey; ComponentLink7URL: https://datasheet.ciiva.com/337/cd00212838-337651.pdf?src-supplier=Digikey; ComponentLink7Description: https://datasheet.ciiva.com/337/cd00212838-337651.pdf?src-supplier=Digikey; ComponentLink8URL: https://datasheet.ciiva.com/337/cd00212838-337653.pdf?src-supplier=Digikey; ComponentLink8Description: https://datasheet.ciiva.com/337/cd00212838-337653.pdf?src-supplier=Digikey; ComponentLink9URL: https://datasheet.ciiva.com/11193/cd00212838-11193350.pdf?src-supplier=Avnet; ComponentLink9Description: https://datasheet.ciiva.com/11193/cd00212838-11193350.pdf?src-supplier=Avnet; ComponentLink10URL: https://datasheet.ciiva.com/41443/001184301-da-01-en-transil-sgl-un-esdalc6v1-1u2-st-0201-stm-41443159.pdf?src-supplier=Conrad; ComponentLink10Description: https://datasheet.ciiva.com/41443/001184301-da-01-en-transil-sgl-un-esdalc6v1-1u2-st-0201-stm-41443159.pdf?src-supplier=Conrad
FB1 = FCM1608KF-601T03: 500mΩ ±25% 600Ω@100MHz 0603 Ferrite Beads ROHS; Manufacturer: Tai Tech; Current Rating: 350mA; Number of Circuits: 1NUMBER; Impedance: 600R; DC Resistance (DCR): 500mR; Supplier: Digikey; LCSC Part Number: C141723; Manufacturer Part Number: FCM1608KF-601T03; RoHS: No; Item Type: Ferrite Bead; Pricing: 1=0.1, 10=0.02, 25=0.0176, 50=0.0158, 100=0.0142, 250=0.01236, 500=0.01106, 1000=0.00986 (USD); Length: 1.6mm; Width: 800um; Height: 800um; Reach SVHC Compliant: 4188SVHC
FB2 = BLM15HG102SN1D: FERRITE BEAD 1 KOHM 0402 1LN; Manufacturer: Murata; Item Type: Ferrite Beads; Material: Steel,Ferrite; Impedance: 1kR; Tolerance: 25%; Current Rating: 250mA; Number of Lines: 1; DC Resistance (DCR): 1.1R; Test Frequency: 100MHz; Shielding: 202Shielding; Number of Circuits: 1NUMBER; Supplier: Arrow Electronics; LCSC Part Number: C76889; Manufacturer Part Number: BLM15HG102SN1D; RoHS: Yes; Stock: 520000; Pricing: 10000=0.0226 (USD); Case/Package: 0402; Pins: 2; Core Material: Ferrite; Case Code (Metric): 1005; Case Code (Imperial): 0402; Min Operating Temperature: -55°C; Max Operating Temperature: 125°C; Package Quantity: 1; Packaging: Tape and Reel; Max Current Rating: 250mA; Max DC Current: 250mA; Termination: SMD/SMT; DC Current: 250mA; Series: BLM15H; DC Resistance-Max: 1.1R; Frequency: 100MHz; RMS Current (Irms): 250mA; ESR: 1.1R; Length: 1mm; Width: 0.5mm; Height: 0.5mm; Depth: 0.5mm; Radiation Hardening: No; Reach SVHC Compliant: No; Military Standard: Not; RoHS Compliant: Yes; Lead Free: 5697LeadFree; ComponentLink1URL: https://datasheet.ciiva.com/11799/0900766b811b5866-11799183.pdf?src-supplier=Rs; ComponentLink1Description: https://datasheet.ciiva.com/11799/0900766b811b5866-11799183.pdf?src-supplier=Rs; ComponentLink2URL: https://datasheet.ciiva.com/18089/getdatasheetpartid-153017-18089624.pdf?src-supplier=Verical; ComponentLink2Description: https://datasheet.ciiva.com/18089/getdatasheetpartid-153017-18089624.pdf?src-supplier=Verical; ComponentLink3URL: https://datasheet.ciiva.com/41449/001172203-da-01-en-drossel-0402-1000r-21-0x0-5mm-10000st-41449490.pdf?src-supplier=Conrad; ComponentLink3Description: https://datasheet.ciiva.com/41449/001172203-da-01-en-drossel-0402-1000r-21-0x0-5mm-10000st-41449490.pdf?src-supplier=Conrad; ComponentLink4URL: https://datasheet.ciiva.com/29347/442241-da-01-en-chip-drossel-0402-1000r-250ma-1-0x0-5mm-29347884.pdf?src-supplier=Conrad; ComponentLink4Description: https://datasheet.ciiva.com/29347/442241-da-01-en-chip-drossel-0402-1000r-250ma-1-0x0-5mm-29347884.pdf?src-supplier=Conrad; ComponentLink5URL: https://datasheet.ciiva.com/1466/5168-1466915.pdf?src-supplier=Element14; ComponentLink5Description: https://datasheet.ciiva.com/1466/5168-1466915.pdf?src-supplier=Element14; ComponentLink6URL: https://datasheet.ciiva.com/1466/5168-1466916.pdf?src-supplier=Element14; ComponentLink6Description: https://datasheet.ciiva.com/1466/5168-1466916.pdf?src-supplier=Element14; ComponentLink7URL: https://datasheet.ciiva.com/1012/l0110s0101blm15h-1012789.pdf?src-supplier=Digikey; ComponentLink7Description: https://datasheet.ciiva.com/1012/l0110s0101blm15h-1012789.pdf?src-supplier=Digikey; ComponentLink8URL: https://datasheet.ciiva.com/1012/l0110s0101blm15h-1012788.pdf?src-supplier=Digikey; ComponentLink8Description: https://datasheet.ciiva.com/1012/l0110s0101blm15h-1012788.pdf?src-supplier=Digikey; ComponentLink9URL: https://datasheet.ciiva.com/1012/l0110s0101blm15h-1012790.pdf?src-supplier=Digikey; ComponentLink9Description: https://datasheet.ciiva.com/1012/l0110s0101blm15h-1012790.pdf?src-supplier=Digikey
J5 = X6511WV-03H-C60D30: Gold 250V 3A Straight Square Pins 2.5mm 3P 260℃ 6mm -40℃~+105℃ 3mm 2.54mm Plugin Black Brass 1x3P Plugin,P=2.54mm Pin Headers ROHS; Manufacturer: XKB; Item Type: Male Header; Manufacturer Part Number: X6511WV-03H-C60D30; Package: Plugin,P=2.54mm; LCSC Part Number: C706875; ComponentLink1Description: LCSC; ComponentLink1URL: https://www.lcsc.com/product-detail/Pin-Headers_XKB-Connectivity-X6511WV-03H-C60D30_C706875.html
J6 = C145963: 1x6P SH 1 1mm 6 SMD,P=1mm Wire To Board / Wire To Wire Connector ROHS; Manufacturer: BOOMELE; Manufacturer Part Number: C145963; Package: SMD,P=1mm; LCSC Part Number: C145963; Item Type: Connector; ComponentLink1Description: LCSC; ComponentLink1URL: https://www.lcsc.com/product-detail/Wire-To-Board-Wire-To-Wire-Connector_BOOMELE-Boom-Precision-Elec-C145963_C145963.html
J7 = X1321WVS-2x05J-C40D53: Gold 250V 1A Brick nogging Square Pins 1mm 10P 260℃ 4mm -40℃~+105℃ 1.27mm 双排 Black Brass 2x5P SMD,P=1.27mm Pin Headers ROHS; Manufacturer: XKB Connectivity; Item Type: Male Header; Manufacturer Part Number: X1321WVS-2x05J-C40D53; Package: SMD,P=1.27mm; LCSC Part Number: C2881910; ComponentLink1Description: LCSC; ComponentLink1URL: https://www.lcsc.com/product-detail/Pin-Headers_XKB-Connectivity-X1321WVS-2x05J-C40D53_C2881910.html
L2 = MLZ2012M150WT000: FIXED IND 15UH 250MA 950MOHM SMD; Manufacturer: TDK; Item Type: Fixed Inductors; Core Material: Ferrite; Self Resonant Frequency: 40MHz; Tolerance: 20%; Saturation Current: 120mA; Shielding: Shielded; DC Resistance (DCR): 950mR; Test Frequency: 2MHz; ESR: 1.235R; Supplier: Arrow Electronics; LCSC Part Number: C383402; Manufacturer Part Number: MLZ2012M150WT000; RoHS: Yes; Stock: 144000; Pricing: 2000=0.0432, 10000=0.0391, 24000=0.037, 50000=0.0337 (USD); Mounting Technology: Surface Mount; Case/Package: 0805; Case Code (Metric): 2012; Case Code (Imperial): 0805; Min Operating Temperature: -55°C; Max Operating Temperature: 125°C; Packaging: Cut Tape; Value: 15uH; Series: MLZ; RMS Current (Irms): 250mA; Height: 1.45mm; RoHS Compliant: Yes; ComponentLink1URL: https://datasheet.ciiva.com/29690/inductor-commercial-decoupling-mlz-en-29690328.pdf?src-supplier=Digikey; ComponentLink1Description: https://datasheet.ciiva.com/29690/inductor-commercial-decoupling-mlz-en-29690328.pdf?src-supplier=Digikey; ComponentLink2URL: https://datasheet.ciiva.com/29690/inductor-commercial-decoupling-mlz-en-29690327.pdf?src-supplier=Digikey; ComponentLink2Description: https://datasheet.ciiva.com/29690/inductor-commercial-decoupling-mlz-en-29690327.pdf?src-supplier=Digikey; ComponentLink3URL: https://datasheet.ciiva.com/29690/inductor-commercial-decoupling-mlz-en-29690329.pdf?src-supplier=Digikey; ComponentLink3Description: https://datasheet.ciiva.com/29690/inductor-commercial-decoupling-mlz-en-29690329.pdf?src-supplier=Digikey
L3 = LQW15AN47NG00D: FIXED IND 47NH 210MA 1.08OHM SMD; Manufacturer: Murata; Item Type: Fixed Inductors; Core Material: Non-Magnetic,Air,Ferrite; Tolerance: 2%; DC Resistance (DCR): 1.08R; Shielding: Unshielded; Q Factor: 25; Current: 600mA; Self Resonant Frequency: 2.9GHz; Test Frequency: 100MHz; Supplier: Arrow Electronics; LCSC Part Number: C22334; Manufacturer Part Number: LQW15AN47NG00D; RoHS: Yes; Stock: 371; Pricing: 371=0.0431 (USD); Mounting Technology: Surface Mount; Case/Package: 0402; Pins: 2; Weight: 2.8E-05oz; Case Code (Metric): 1005; Case Code (Imperial): 0402; Min Operating Temperature: -55°C; Max Operating Temperature: 125°C; Value: 47nH; Max DC Current: 210mA; Packaging: Tape and Reel; Package Quantity: 1; Inductance Tolerance: 2%; Termination: SMD/SMT; DC Current: 210mA; Series: LQW15A_00; RMS Current (Irms): 210mA; ESR: 1.08R; Length: 1mm; Width: 0.5mm; Height: 0.5mm; Depth: 0.6mm; Reach SVHC Compliant: No; Military Standard: Not; Lead Free: Lead Free; RoHS Compliant: Yes; ComponentLink1URL: https://datasheet.ciiva.com/11799/0900766b8090d800-11799167.pdf?src-supplier=Rs; ComponentLink1Description: https://datasheet.ciiva.com/11799/0900766b8090d800-11799167.pdf?src-supplier=Rs; ComponentLink2URL: https://datasheet.ciiva.com/6709/l0075s0080lqw15a-00-6709897.pdf?src-supplier=Digikey; ComponentLink2Description: https://datasheet.ciiva.com/6709/l0075s0080lqw15a-00-6709897.pdf?src-supplier=Digikey; ComponentLink3URL: https://datasheet.ciiva.com/6709/l0075s0080lqw15a-00-6709899.pdf?src-supplier=Digikey; ComponentLink3Description: https://datasheet.ciiva.com/6709/l0075s0080lqw15a-00-6709899.pdf?src-supplier=Digikey; ComponentLink4URL: https://datasheet.ciiva.com/4976/product-4976502.pdf?src-supplier=Mouser; ComponentLink4Description: https://datasheet.ciiva.com/4976/product-4976502.pdf?src-supplier=Mouser; ComponentLink5URL: https://datasheet.ciiva.com/8507/l0075s0080lqw15a-00-8507529.pdf?src-supplier=Avnet; ComponentLink5Description: https://datasheet.ciiva.com/8507/l0075s0080lqw15a-00-8507529.pdf?src-supplier=Avnet; ComponentLink6URL: https://datasheet.ciiva.com/16455/l0075s0080lqw15a-00-16455878.pdf?src-supplier=Future+Electronics; ComponentLink6Description: https://datasheet.ciiva.com/16455/l0075s0080lqw15a-00-16455878.pdf?src-supplier=Future+Electronics
L4 = LQW15AN3N3D10D: FIXED IND 3.3NH 900MA 0.04OHM SM; Manufacturer: Murata; Item Type: Fixed Inductors; Core Material: Non-Magnetic,Air; DC Resistance (DCR): 40mR; Shielding: Unshielded; Current: 800mA; Self Resonant Frequency: 12GHz; Test Frequency: 100MHz; Supplier: Arrow Electronics; LCSC Part Number: C98061; Manufacturer Part Number: LQW15AN3N3D10D; RoHS: Yes; Stock: 20000; Pricing: 10000=0.0448 (USD); Mounting Technology: Surface Mount; Case/Package: 0402; Pins: 2; Weight: 2.8E-05oz; Case Code (Metric): 1005; Case Code (Imperial): 0402; Min Operating Temperature: -55°C; Max Operating Temperature: 125°C; Value: 3.3nH; Max DC Current: 900mA; Packaging: Tape and Reel; Package Quantity: 1; Current Rating: 900mA; Termination: SMD/SMT; DC Current: 900mA; Series: LQW15A_10; Max Current Rating: 900mA; Length: 1mm; Width: 0.02inch; Height: 0.5mm; Depth: 0.7mm; Height - Seated (Max): 0.024inch; Radiation Hardening: No; Reach SVHC Compliant: No; Military Standard: Not; Lead Free: Lead Free; RoHS Compliant: Yes; ComponentLink1URL: https://datasheet.ciiva.com/11799/0900766b8090d5c4-11799120.pdf?src-supplier=Rs; ComponentLink1Description: https://datasheet.ciiva.com/11799/0900766b8090d5c4-11799120.pdf?src-supplier=Rs; ComponentLink2URL: https://datasheet.ciiva.com/6705/l0075s0080lqw15a-10-6705512.pdf?src-supplier=Digikey; ComponentLink2Description: https://datasheet.ciiva.com/6705/l0075s0080lqw15a-10-6705512.pdf?src-supplier=Digikey; ComponentLink3URL: https://datasheet.ciiva.com/6705/l0075s0080lqw15a-10-6705511.pdf?src-supplier=Digikey; ComponentLink3Description: https://datasheet.ciiva.com/6705/l0075s0080lqw15a-10-6705511.pdf?src-supplier=Digikey; ComponentLink4URL: https://datasheet.ciiva.com/6705/l0075s0080lqw15a-10-6705513.pdf?src-supplier=Digikey; ComponentLink4Description: https://datasheet.ciiva.com/6705/l0075s0080lqw15a-10-6705513.pdf?src-supplier=Digikey; ComponentLink5URL: https://datasheet.ciiva.com/4976/product-4976988.pdf?src-supplier=Mouser; ComponentLink5Description: https://datasheet.ciiva.com/4976/product-4976988.pdf?src-supplier=Mouser; ComponentLink6URL: https://datasheet.ciiva.com/8506/l0075s0080lqw15a-10-8506007.pdf?src-supplier=Avnet; ComponentLink6Description: https://datasheet.ciiva.com/8506/l0075s0080lqw15a-10-8506007.pdf?src-supplier=Avnet; ComponentLink7URL: https://datasheet.ciiva.com/16455/l0075s0080lqw15a-10-16455870.pdf?src-supplier=Future+Electronics; ComponentLink7Description: https://datasheet.ciiva.com/16455/l0075s0080lqw15a-10-16455870.pdf?src-supplier=Future+Electronics
L5 = LQW15AN8N2G00D: FIXED IND 8.2NH 540MA 0.14OHM SM; Manufacturer: Murata; Item Type: Fixed Inductors; Core Material: Non-Magnetic,Ferrite; Tolerance: 2%; DC Resistance (DCR): 140mR; Shielding: Unshielded; Self Resonant Frequency: 5.5GHz; Q Factor: 25; Test Frequency: 100MHz; Supplier: Mouser; LCSC Part Number: C84404; Manufacturer Part Number: LQW15AN8N2G00D; RoHS: Yes; Stock: 47249; Pricing: 1=0.11, 10=0.094, 50=0.094, 100=0.078, 1000=0.064, 10000=0.052 (USD); Mounting Technology: Surface Mount; Case/Package: 0402; Pins: 2; Weight: 2.8E-05oz; Case Code (Metric): 1005; Case Code (Imperial): 0402; Min Operating Temperature: -55°C; Max Operating Temperature: 125°C; Value: 8.2nH; Packaging: Tape and Reel; Max DC Current: 540mA; Series: LQW15A_00; Package Quantity: 1; Inductance Tolerance: 2%; Termination: SMD/SMT; DC Current: 540mA; Max Current Rating: 540mA; RMS Current (Irms): 540mA; ESR: 140mR; Length: 1mm; Width: 0.5mm; Height: 0.5mm; Depth: 0.7mm; Radiation Hardening: No; Reach SVHC Compliant: No; Lead Free: Lead Free; Military Standard: Not; RoHS Compliant: Yes; ComponentLink1URL: https://datasheet.ciiva.com/11799/0900766b8090d800-11799384.pdf?src-supplier=Rs; ComponentLink1Description: https://datasheet.ciiva.com/11799/0900766b8090d800-11799384.pdf?src-supplier=Rs; ComponentLink2URL: https://datasheet.ciiva.com/16455/l0075s0080lqw15a-00-16455832.pdf?src-supplier=Future+Electronics; ComponentLink2Description: https://datasheet.ciiva.com/16455/l0075s0080lqw15a-00-16455832.pdf?src-supplier=Future+Electronics
L6 = LQW15AN9N1G8ZD: FIXED IND 9.1NH 1.4A 0.08OHM SMD; Manufacturer: Murata; Item Type: Fixed Inductors; Supplier: Mouser; LCSC Part Number: C1330593; Manufacturer Part Number: LQW15AN9N1G8ZD; RoHS: Yes; Stock: 16863; Pricing: 1=0.16, 10=0.134, 50=0.118, 100=0.111, 1000=0.091, 10000=0.074 (USD); ComponentLink1URL: https://search.murata.co.jp/Ceramy/image/img/P02/JELF243A-9138.pdf?src-supplier=Digikey; ComponentLink1Description: https://search.murata.co.jp/Ceramy/image/img/P02/JELF243A-9138.pdf?src-supplier=Digikey; ComponentLink2URL: https://datasheet.octopart.com/LQW15AN9N1G8ZD-Murata-datasheet-140317541.pdf?src-supplier=Farnell; ComponentLink2Description: https://datasheet.octopart.com/LQW15AN9N1G8ZD-Murata-datasheet-140317541.pdf?src-supplier=Farnell
R12-R24 R29 R30 R34 R35 R37-R39 = RC0402FR-070RL: RES 0 OHM JUMPER 1/16W 0402; Manufacturer: Yageo; Item Type: Resistors; Tolerance: 1%; Power Rating: 62.5mW; Voltage Rating: 50V; Temperature Coefficient: 200ppm/°C; Max Power Dissipation: 63mW; Supplier 1: Mouser; Manufacturer Part Number: RC0402FR-070RL; RoHS: Yes; Stock 1: 8556842; Pricing 1: 1=0.10000, 10=0.01400, 50=0.01400, 100=0.00600, 1000=0.00300, 5000=0.00200, 10000=0.00100 (USD); Mount: Surface Mount; Case/Package: 0402; Contact Plating: Tin,Matte; Case Code (Imperial): 0402; Case Code (Metric): 1005; Size Code: 0402; Min Operating Temperature: -55°C; Max Operating Temperature: 155°C; Resistance: 0R; Resistor Type: Thick Film; Packaging: Tape and Reel; Termination: SMD/SMT; Features: Moisture Resistant; Series: RC; Number of Terminations: 2; Length: 1mm; Width: 0.5mm; Height: 0.35mm; Radiation Hardening: No; Lead Free: Lead Free; RoHS Compliant: Yes; ComponentLink1URL: https://datasheet.ciiva.com/8896/pyu-rc0402-51-rohs-l-6-8896149.pdf?src-supplier=Avnet; ComponentLink1Description: https://datasheet.ciiva.com/8896/pyu-rc0402-51-rohs-l-6-8896149.pdf?src-supplier=Avnet; ComponentLink2URL: https://datasheet.ciiva.com/16790/pyu-rc0402-51-rohs-l-6-r-16790444.pdf?src-supplier=Future+Electronics; ComponentLink2Description: https://datasheet.ciiva.com/16790/pyu-rc0402-51-rohs-l-6-r-16790444.pdf?src-supplier=Future+Electronics; Supplier Part Number 1: 603-RC0402FR-070RL; LCSC Part Number: C106231
R25 R26 R45 = RC0402FR-0710KL: RES 10K OHM 1% 1/16W 0402; Manufacturer: Yageo; Resistance: 10kR; Voltage Rating (DC): 50V; Temperature Coefficient: 100ppm/°C; Power Rating: 62.5mW; Max Power Dissipation: 63mW; Item Type: Resistor; Supplier 1: Mouser; Manufacturer Part Number: RC0402FR-0710KL; RoHS: Yes; Category: Chip SMD Resistors; Stock 1: 18648329; Pricing 1: 1=0.10000, 10=0.01400, 50=0.01400, 100=0.00500, 1000=0.00300, 10000=0.00200 (USD); Case/Package: 0402; Number of Pins: 2; Case Code (Imperial): 0402; Case Code (Metric): 1005; Min Operating Temperature: -55°C; Max Operating Temperature: 155°C; Resistor Type: Thick Film; Tolerance: 1%; Packaging: Tape and Reel; Voltage Rating: 50V; Termination: SMD/SMT; Working Voltage: 50V; Number of Terminations: 2; Features: Moisture Resistant; Series: RC; Resistance Tolerance: 1%; Construction: Rectangular; Length: 1mm; Width: 0.5mm; Height: 0.32mm; Depth: 0.5mm; Lead Pitch: 0.2mm; REACH SVHC: No SVHC; Lead Free: Lead Free; RoHS Compliant: Yes; Military Standard: Not; ComponentLink1URL: https://datasheet.ciiva.com/7660/38568-7660787.pdf?src-supplier=Element14; ComponentLink1Description: https://datasheet.ciiva.com/7660/38568-7660787.pdf?src-supplier=Element14; ComponentLink2URL: https://datasheet.ciiva.com/7849/1686128-7849814.pdf?src-supplier=Element14; ComponentLink2Description: https://datasheet.ciiva.com/7849/1686128-7849814.pdf?src-supplier=Element14; ComponentLink3URL: https://datasheet.ciiva.com/7983/1018594-7983486.pdf?src-supplier=Element14; ComponentLink3Description: https://datasheet.ciiva.com/7983/1018594-7983486.pdf?src-supplier=Element14; ComponentLink4URL: https://datasheet.ciiva.com/22747/1018594-22747512.pdf?src-supplier=Element14; ComponentLink4Description: https://datasheet.ciiva.com/22747/1018594-22747512.pdf?src-supplier=Element14; ComponentLink5URL: https://datasheet.ciiva.com/12667/pyu-rc0402-51-rohs-l-6-r-12667067.pdf?src-supplier=Mouser; ComponentLink5Description: https://datasheet.ciiva.com/12667/pyu-rc0402-51-rohs-l-6-r-12667067.pdf?src-supplier=Mouser; ComponentLink6URL: https://datasheet.ciiva.com/7849/1784430-7849813.pdf?src-supplier=Element14; ComponentLink6Description: https://datasheet.ciiva.com/7849/1784430-7849813.pdf?src-supplier=Element14; ComponentLink7URL: https://datasheet.ciiva.com/7849/1784430-7849815.pdf?src-supplier=Element14; ComponentLink7Description: https://datasheet.ciiva.com/7849/1784430-7849815.pdf?src-supplier=Element14; Supplier Part Number 1: 603-RC0402FR-0710KL; LCSC Part Number: C60490